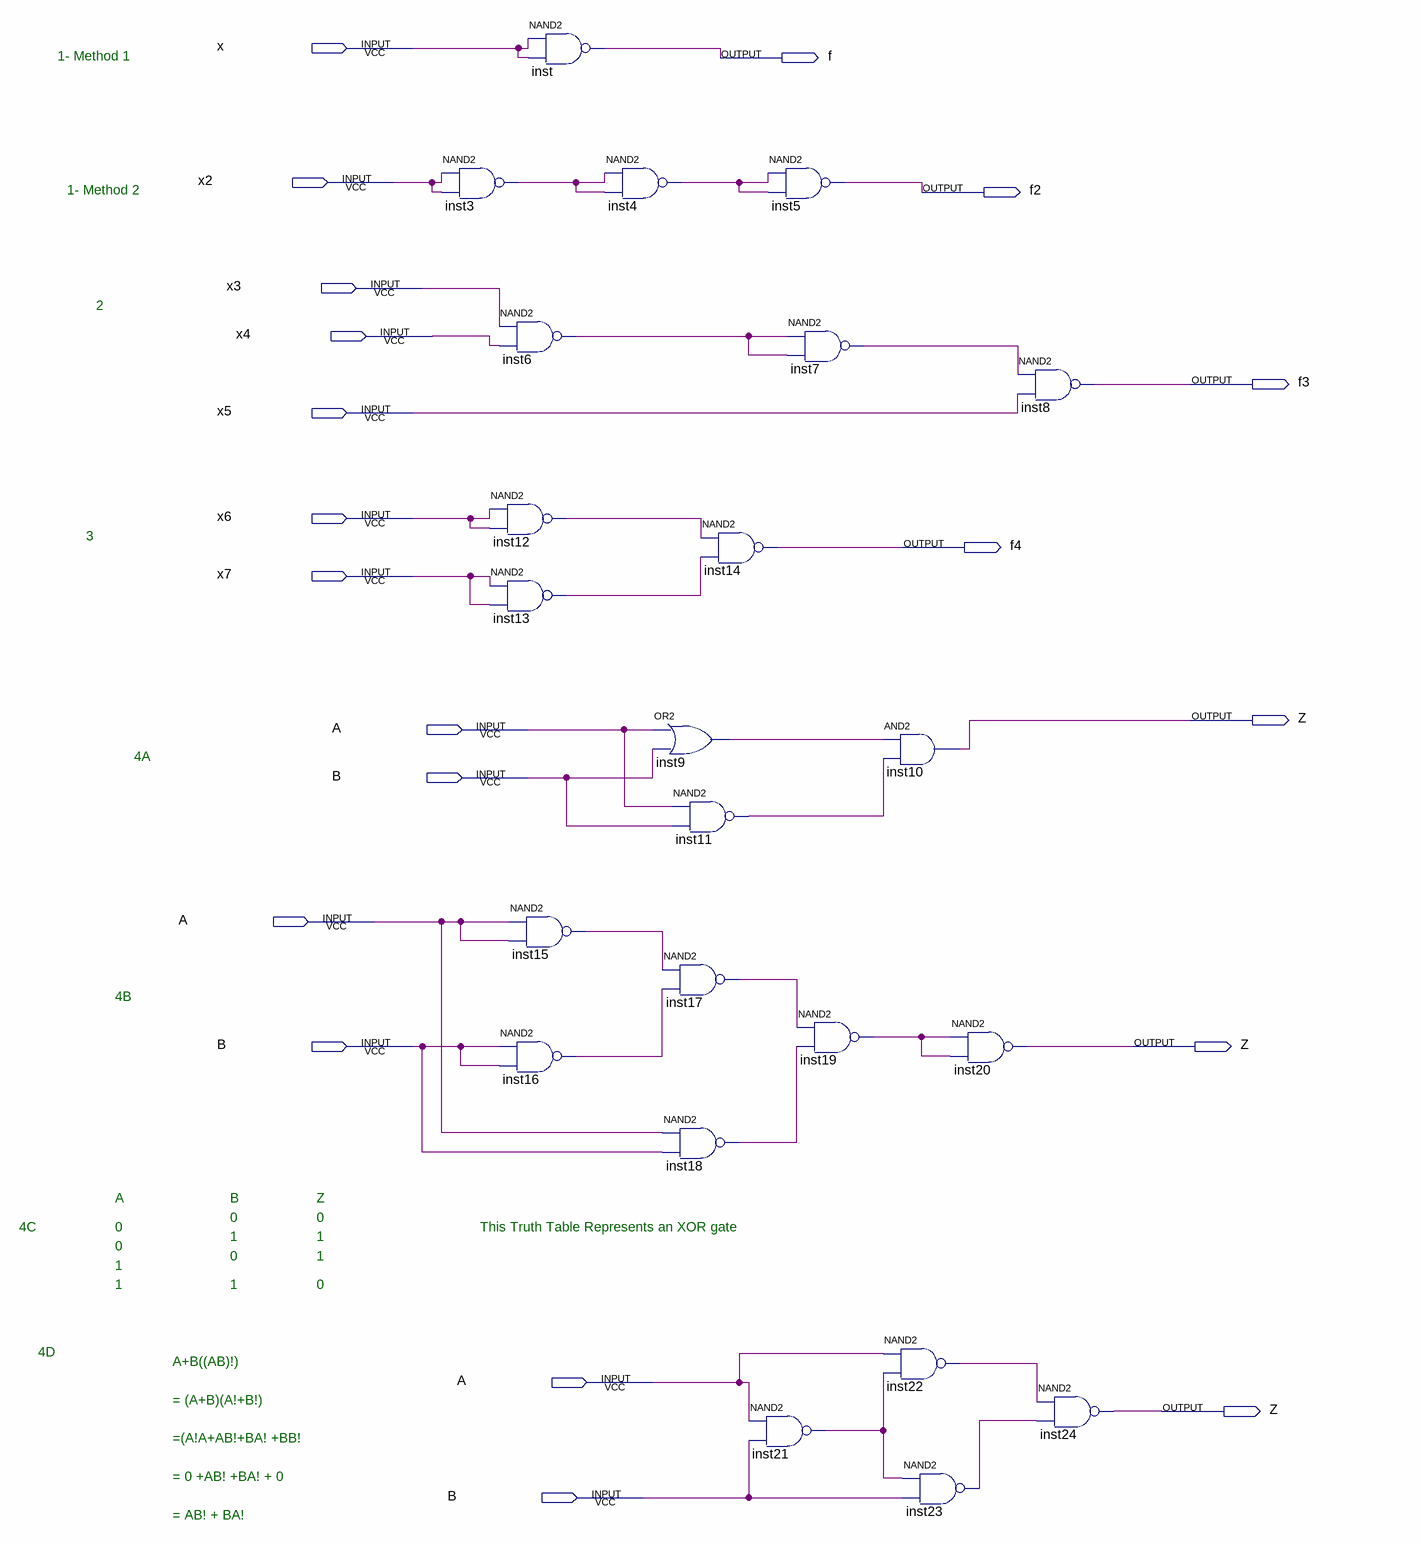
[diagram p0: schematic sheet]
// Quartus schematic coe328_lab2.bdf as structural Verilog: 23 symbols, 20 pins
module coe328_lab2 (
  input  x,
  input  x2,
  input  x3,
  input  x4,
  input  x5,
  input  x6,
  input  x7,
  input  A,
  input  B,
  output f,
  output f2,
  output f3,
  output f4,
  output Z
);

  wire inst3_out, inst4_out, inst6_out, inst7_out, inst9_out, inst11_out, inst12_out, inst13_out, inst15_out,
       inst16_out, inst17_out, inst18_out, inst19_out, inst21_out, inst22_out, inst23_out;

  nand inst3 (inst3_out, x2, x2);
  nand inst6 (inst6_out, x3, x4);
  nand inst12 (inst12_out, x6, x6);
  nand inst13 (inst13_out, x7, x7);
  nand inst16 (inst16_out, B, B);
  nand inst (f, x, x);
  nand inst15 (inst15_out, A, A);
  nand inst4 (inst4_out, inst3_out, inst3_out);
  or inst9 (inst9_out, A, B);
  nand inst14 (f4, inst12_out, inst13_out);
  nand inst11 (inst11_out, A, B);
  nand inst17 (inst17_out, inst15_out, inst16_out);
  nand inst18 (inst18_out, A, B);
  nand inst5 (f2, inst4_out, inst4_out);
  nand inst7 (inst7_out, inst6_out, inst6_out);
  nand inst19 (inst19_out, inst17_out, inst18_out);
  nand inst21 (inst21_out, A, B);
  and inst10 (Z, inst9_out, inst11_out);
  nand inst22 (inst22_out, A, inst21_out);
  nand inst20 (Z, inst19_out, inst19_out);
  nand inst23 (inst23_out, inst21_out, B);
  nand inst8 (f3, inst7_out, x5);
  nand inst24 (Z, inst22_out, inst23_out);

  // Notes on the sheet:
  //   1- Method 1
  //   1- Method 2
  //   2
  //   3
  //   4A
  //   4B
  //   A
  //   B
  //   Z
  //   0
  //   0
  //   4C
  //   0
  //   This Truth Table Represents an XOR gate
  //   1
  //   1
  //   0
  //   0
  //   1
  //   1
  //   1
  //   1
  //   0
  //   4D
  //   A+B((AB)!)
  //   = (A+B)(A!+B!)
  //   =(A!A+AB!+BA! +BB!    
  //   = 0 +AB! +BA! + 0  
  //   = AB! + BA!  
endmodule
